# Altium project Adult_Main_Power_Unit.PrjPcb
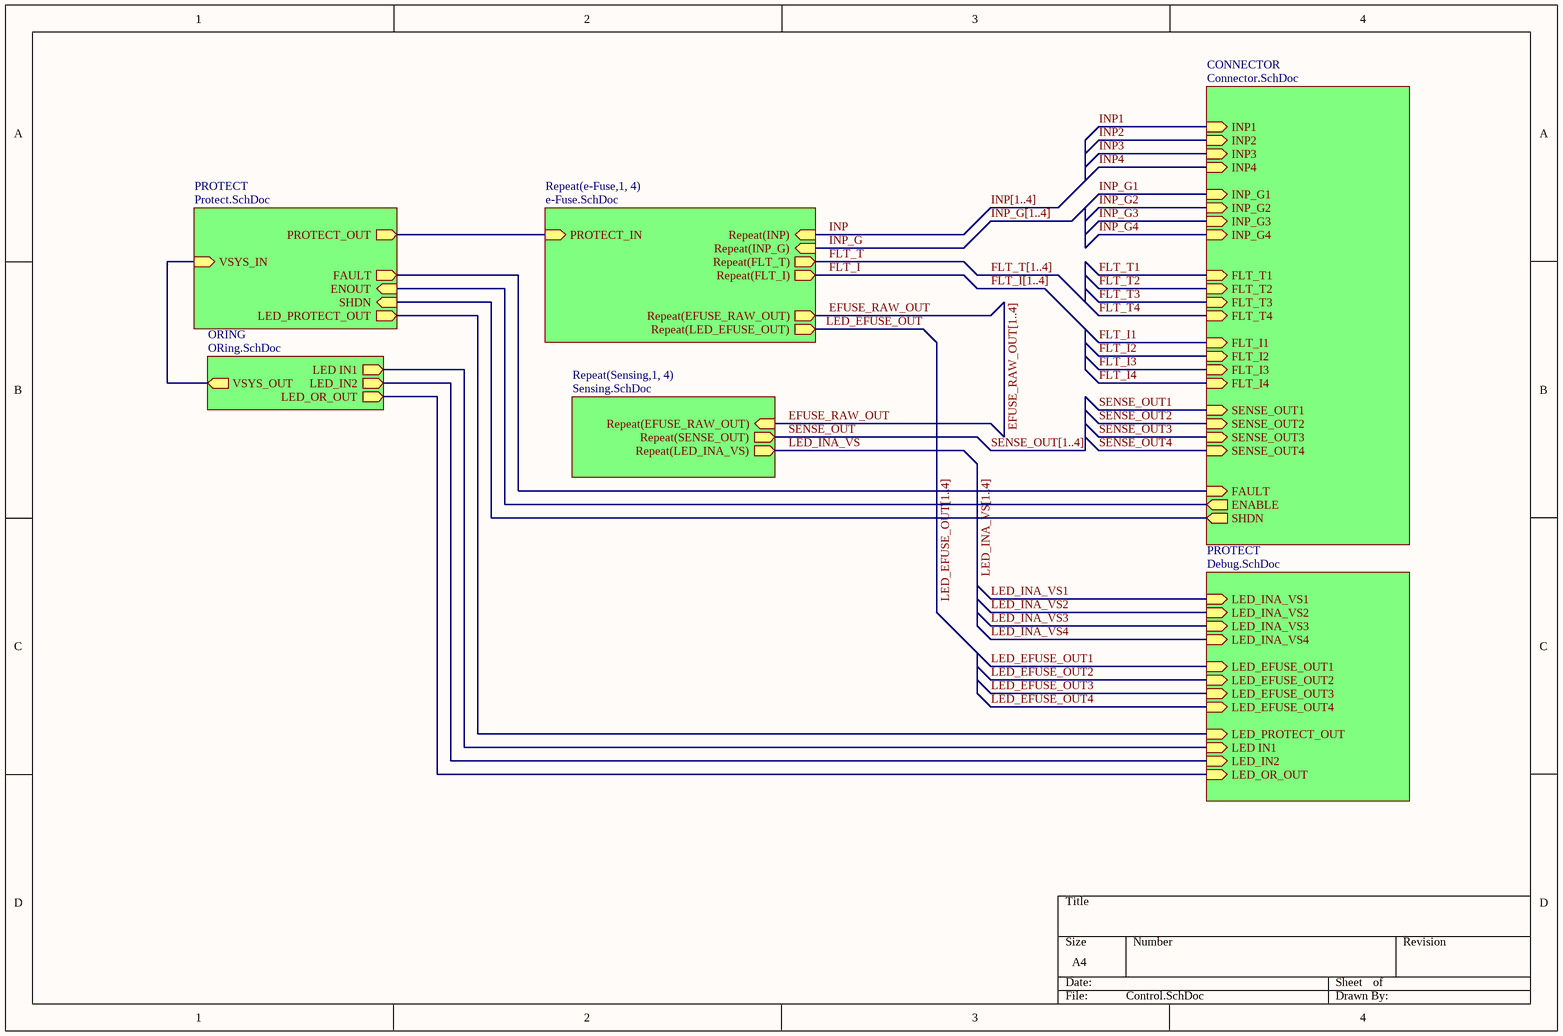
[diagram p0: Control.SchDoc]
7 sheets, 251 parts. Net scope: hierarchical (ports join the sheet entries above them; power ports are global).
Board file: Main_Power_Uint_3rd.PcbDoc
Sheets:
  Control.SchDoc
    PROTECT = Protect.SchDoc
    e-Fuse1 = e-Fuse.SchDoc
    e-Fuse2 = e-Fuse.SchDoc
    e-Fuse3 = e-Fuse.SchDoc
    e-Fuse4 = e-Fuse.SchDoc
    CONNECTOR = Connector.SchDoc
    ORING = ORing.SchDoc
    Sensing1 = Sensing.SchDoc
    Sensing2 = Sensing.SchDoc
    Sensing3 = Sensing.SchDoc
    Sensing4 = Sensing.SchDoc
    PROTECT = Debug.SchDoc

## Sheet Control.SchDoc
size A4; SheetNumber: 1; SheetTotal: 7

### Sub-sheets
CONNECTOR = Connector.SchDoc: FLT_I4 (in), FLT_T4 (in), INP_G4 (in), INP4 (in), FLT_I3 (in), FLT_T3 (in), INP_G3 (in), INP3 (in), FLT_I2 (in), FLT_T2 (in), INP_G2 (in), INP2 (in), FLT_I1 (in), FLT_T1 (in), INP_G1 (in), INP1 (in), SENSE_OUT4 (in), SENSE_OUT3 (in), SENSE_OUT2 (in), SENSE_OUT1 (in), FAULT (in), ENABLE (out), SHDN (out)
ORING = ORing.SchDoc: LED IN1 (out), LED_IN2 (out), LED_OR_OUT (out), VSYS_OUT (out)
PROTECT = Protect.SchDoc: PROTECT_OUT (out), SHDN (in), FAULT (out), VSYS_IN (in), ENOUT (in), LED_PROTECT_OUT (out)
PROTECT = Debug.SchDoc: LED_INA_VS1 (in), LED_INA_VS2 (in), LED_INA_VS3 (in), LED_INA_VS4 (in), LED_OR_OUT (in), LED_IN2 (in), LED IN1 (in), LED_PROTECT_OUT (in), LED_EFUSE_OUT1 (in), LED_EFUSE_OUT2 (in), LED_EFUSE_OUT3 (in), LED_EFUSE_OUT4 (in)
Repeat(e-Fuse,1, 4) = e-Fuse.SchDoc: Repeat(EFUSE_RAW_OUT) (out), Repeat(FLT_I) (out), Repeat(FLT_T) (out), Repeat(INP_G) (in), Repeat(INP) (in), PROTECT_IN (in), Repeat(LED_EFUSE_OUT) (out)
Repeat(Sensing,1, 4) = Sensing.SchDoc: Repeat(EFUSE_RAW_OUT) (in), Repeat(SENSE_OUT) (out), Repeat(LED_INA_VS) (out)

### Nets
VSYS_IN: sheet PROTECT/VSYS_IN, sheet ORING/VSYS_OUT
EFUSE_RAW_OUT: sheet Repeat(e-Fuse,1, 4)/Repeat(EFUSE_RAW_OUT), sheet Repeat(Sensing,1, 4)/Repeat(EFUSE_RAW_OUT)
ENOUT: sheet PROTECT/ENOUT, sheet CONNECTOR/ENABLE
FAULT: sheet PROTECT/FAULT, sheet CONNECTOR/FAULT
FLT_I: sheet Repeat(e-Fuse,1, 4)/Repeat(FLT_I)
FLT_T: sheet Repeat(e-Fuse,1, 4)/Repeat(FLT_T)
I_SENSE_N: sheet PROTECT/PROTECT_OUT, sheet Repeat(e-Fuse,1, 4)/PROTECT_IN
INP: sheet Repeat(e-Fuse,1, 4)/Repeat(INP)
INP_G: sheet Repeat(e-Fuse,1, 4)/Repeat(INP_G)
LED IN1: sheet ORING/LED IN1, sheet PROTECT/LED IN1
LED IN2: sheet ORING/LED_IN2, sheet PROTECT/LED_IN2
LED_EFUSE_OUT: sheet Repeat(e-Fuse,1, 4)/Repeat(LED_EFUSE_OUT)
LED_INA_VS: sheet Repeat(Sensing,1, 4)/Repeat(LED_INA_VS)
LED_OR_OUT: sheet ORING/LED_OR_OUT, sheet PROTECT/LED_OR_OUT
SENSE_OUT: sheet Repeat(Sensing,1, 4)/Repeat(SENSE_OUT)
SHDN: sheet PROTECT/SHDN, sheet CONNECTOR/SHDN
NetJ?_2: sheet PROTECT/LED_PROTECT_OUT, sheet PROTECT/LED_PROTECT_OUT

### Buses and harness runs
bus EFUSE_RAW_OUT[1..4]
bus FLT_I[1..4]
bus FLT_T[1..4]
bus INP[1..4]
bus INP_G[1..4]
bus LED_EFUSE_OUT[1..4]
bus LED_INA_VS[1..4]
bus SENSE_OUT[1..4]

## Sheet Protect.SchDoc
size A2; SheetNumber: 3; SheetTotal: 7; SPICEModelCacheXTCJCDQW: <root> / <DocumentId>XTCJCDQW</DocumentId> / <CacheFrame Number="0"> / <Model Name="umk107b7474_a-tr" Kind="CKT"> / <Text>* UMK107B7474_A-TR     SPICE MODEL  ( General Type ) / *-------------------------------------------------------------------------------------------------------- / * Model Generated by TAIYO YUDEN Corporation (http://www.ty-top.com) / * Version 1.0 / * TAIYO YUDEN Control No. 170508_110119 / * Copyright(c) 2012 TAIYO YUDEN CO.,LTD. All Rights Reserved. / *-------------------------------------------------------------------------------------------------------- / * / * Products Name : Multilayer Ceramic Capacitors / * / * Characteristics : / *     Capacitance : 0.47 uF , Rated Voltage : 50V , TCC : X7R / *     Case Size : 1.6 x 0.8 / 0.063 x 0.031 [mm/inch] , Thickness : 0.8 / 0.031 [mm/inch] / *     (Conditions: Temperature = 25 degC , DC Bias Current/Voltage = 0A / 0V) / * / * Frequency Range : 40Hz - 3GHz / * / * External Node Assignments : / * / *  1  o---| |---o  2 / * / *-------------------------------------------------------------------------------------------------------- / .SubCkt UMK107B7474_A-TR 1 2 / **************************** / C0 1 110 0.3527u / Cm 1 101 0.045459u / C1 101 102 0.11169u / Rc1 101 102 6.9463k / C2 102 103 0.051734u / Rc2 102 103 650.62 / C3 103 110 0.038139u / Rc3 103 110 34.263 / C2m 1 301 0.059649u / C21 301 302 0.33581u / Rc21 301 302 11.28k / C22 302 303 0.20392u / Rc22 302 303 18.494k / C23 303 304 0.29488u / Rc23 303 304 12.333k / C24 304 305 0.15021u / Rc24 304 305 1.1637k / C25 305 306 0.15017u / Rc25 305 306 1.0968k / C26 306 307 0.081575u / Rc26 306 307 74.316 / C27 307 308 0.067021u / Rc27 307 308 74.754 / C28 308 309 0.05622u / Rc28 308 309 85.848 / C29 309 110 3839.3p / Rc29 309 110 14.414 / Rp0 1 110 1.06382978723404G / L0 110 120 0.25717n / Lm 120 130 0.18418n / L1 120 121 0.16238n / RL1 121 130 0.10645 / L2 120 122 1.5526n / RL2 122 130 1.0028 / L3 120 123 2.68n / RL3 123 130 1.6719 / CR 120 124 0.037577u / LR 124 125 0.31279n / RR 125 130 90.675m / CL 130 140 1.8724p / LL 130 140 0.25802n / RL 130 140 37.565 / Rs 140 2 10.204m / **************************** / .ends UMK107B7474_A-TR</Text> / </Model> / </CacheFrame> / </root>
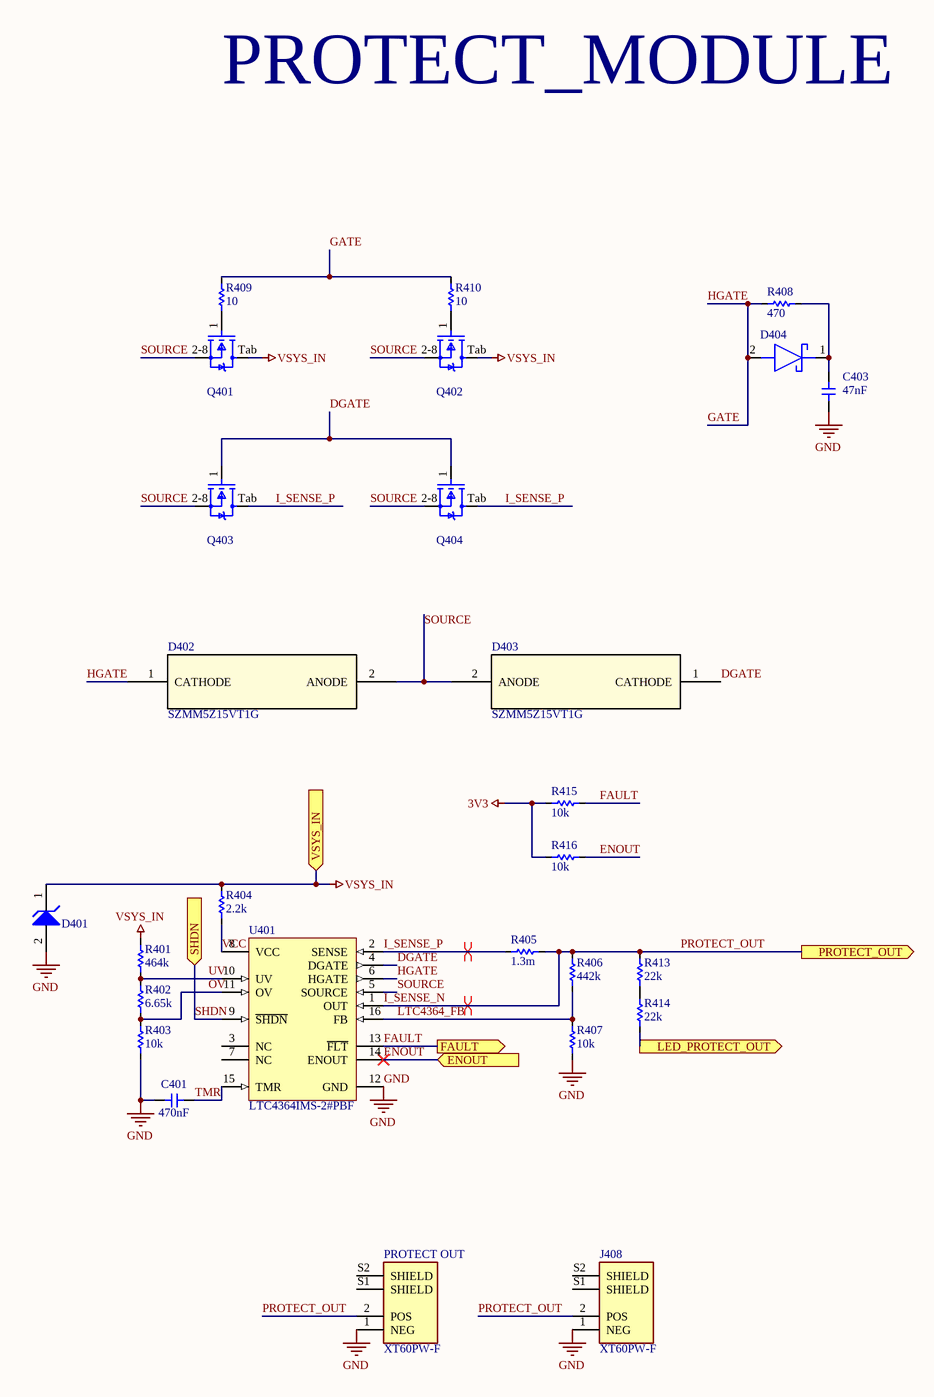
[diagram p1: Protect.SchDoc]

### Parts
C401  Capacitance: 470nF  [C0603]  (hidden comment: C_0603_470NF_10P_50V_X7R)
C403  Capacitance: 47nF  [C0603]  (hidden comment: C_0603_47NF_10P_100V_X7R)
D401  1SMB5945BT3G  [ONSC-SMB-2-403A-03_H_V]  (value not drawn)
D402  SZMM5Z15VT1G  [SOD-523_0P9X1P3_ONS]
D403  SZMM5Z15VT1G  [SOD-523_0P9X1P3_ONS]
D404  SMD110PL-TP  [SODFL3616X135N]  (value not drawn)
J408  XT60PW-F  [XT60PW-F]
PROTECT_OUT  XT60PW-F  [XT60PW-F]
Q401  Trans_Infineon_IPT015N10N5_eec  [Infineon_IPT015N10N5_0]  (value not drawn)
Q402  Trans_Infineon_IPT015N10N5_eec  [Infineon_IPT015N10N5_0]  (value not drawn)
Q403  Trans_Infineon_IPT015N10N5_eec  [Infineon_IPT015N10N5_0]  (value not drawn)
Q404  Trans_Infineon_IPT015N10N5_eec  [Infineon_IPT015N10N5_0]  (value not drawn)
R401  Resistance: 464k  [R0603]  (hidden comment: R_0603_464K_1P_0P1W)
R402  Resistance: 6.65k  [R0603]  (hidden comment: R_0603_6R65K_1P_0P1W)
R403  Resistance: 10k  [R0603]  (hidden comment: R_0603_10K_1P_0P1W)
R404  Resistance: 2.2k  [R2512]  (hidden comment: R_2512_2R2K_1P_2W)
R405  Resistance: 1.3m  [R2512]  (hidden comment: R_2512_1mR3_1P_3W)
R406  Resistance: 442k  [R0603]  (hidden comment: R_0603_442K_1P_0P1W)
R407  Resistance: 10k  [R0603]  (hidden comment: R_0603_10K_1P_0P1W)
R408  Resistance: 470  [R0603]  (hidden comment: R_0603_470R_1P_0P1W)
R409  Resistance: 10  [R0603]  (hidden comment: R_0603_10R_1P_0P1W)
R410  Resistance: 10  [R0603]  (hidden comment: R_0603_10R_1P_0P1W)
R413  Resistance: 22k  [R0603]  (hidden comment: R_0603_22K_1P_0P1W)
R414  Resistance: 22k  [R0603]  (hidden comment: R_0603_22K_1P_0P1W)
R415  Resistance: 10k  [R0603]  (hidden comment: R_0603_10K_1P_0P1W)
R416  Resistance: 10k  [R0603]  (hidden comment: R_0603_10K_1P_0P1W)
U401  LTC4364IMS-2#PBF  [LT-MS-16_M]

### Ports
ENOUT (in, see Control[2B]), FAULT (out, see Control[2B], Connector[2A]), LED_PROTECT_OUT (out, see Control[2B], Debug[2B]), PROTECT_OUT (out, see Control[2A]), SHDN (in, see Control[2B], Connector[2A]), VSYS_IN (in, see Control[1B])

### Nets
3V3: R415.1 R416.1
GND: C401.1 C403.1 D401.2(A) J408.1(NEG) PROTECT_OUT.1(NEG) R403.1 R407.1 U401.12(GND)
VSYS_IN: D401.1(K) Q401.Tab(Drain) Q402.Tab(Drain) R401.2 R404.2 ; port VSYS_IN
DGATE: D403.1(CATHODE) Q403.1(Gate) Q404.1(Gate) U401.4(DGATE)
ENOUT: R416.2 U401.14(ENOUT) ; port ENOUT
FAULT: R415.2 U401.13(~{FLT}) ; port FAULT
GATE: D402.1(CATHODE) D404.2(A) R408.1 R409.2 R410.2 U401.6(HGATE)  [also labelled HGATE]
I_SENSE_N: J408.2(POS) PROTECT_OUT.2(POS) R405.2 R406.2 R413.2 U401.1(OUT) ; port PROTECT_OUT  [also labelled PROTECT_OUT]
I_SENSE_P: Q403.Tab(Drain) Q404.Tab(Drain) R405.1 U401.2(SENSE)
LTC4364_FB: R406.1 R407.2 U401.16(FB)
OV: R402.1 R403.2 U401.11(OV)
SHDN: U401.9(~{SHDN}) ; port SHDN
SOURCE: D402.2(ANODE) D403.2(ANODE) Q401.2-8(Source) Q402.2-8(Source) Q403.2-8(Source) Q404.2-8(Source) U401.5(SOURCE)
TMR: C401.2 U401.15(TMR)
UV: R401.1 R402.2 U401.10(UV)
VCC: R404.1 U401.8(VCC)
NetC403_2: C403.2 D404.1(K) R408.2
NetJ?_2: R414.1 ; port LED_PROTECT_OUT
NetQ401_1: Q401.1(Gate) R409.1
NetQ402_1: Q402.1(Gate) R410.1
NetR413_1: R413.1 R414.2

Not connected (* = marked no-connect by the designer): J408 S1(SHIELD) S2(SHIELD); PROTECT_OUT S1(SHIELD) S2(SHIELD); U401 3(NC) 7(NC)

### Layout directives
differential pair: I_SENSE_N, I_SENSE_P

### Notes on the sheet
- PROTECT_MODULE

### Library data of the parts
C401 = CMP-00074-1: MLCC, 470nF, 10%, 50V, X7R, 0603; Voltage Rating: 50V; Dielectric: X7R; Package: 0603; Tolerance: 10%; Mounting Type: SMD
C403 = CMP-00075-1: MLCC, 47nF, 10%, 100V, X7R, 0603; Tolerance: 10%; Package: 0603; Mounting Type: SMD; Dielectric: X7R; Voltage Rating: 100V
D401 = CMP-1060-00175-1: 3 W Zener Voltage Regulator, 2-Pin SMB, Pb-Free, Tape and Reel; Manufacturer: On Semiconductor; VZ Typ (V): 68; ComponentLink3URL: http://www.onsemi.com/pub_link/Collateral/1SMB5913BT3-D.PDF; PackageReference: SMB-2-403A-03_H; PackageDescription: 2-Pin Small Molded Package, J-Bend Lead, Body 4.33 x 3.625 mm; PackageVersion: Rev. H, 05/2011; PartNumber: 1SMB5945BT3G; DatasheetVersion: Rev. 8; ComponentLink1Description: Manufacturer URL; ComponentLink1URL: http://www.onsemi.com/; RoHS: Pb-Free; ComponentLink2Description: Datasheet; Packing: Tape and Reel; ComponentLink2URL: http://www.onsemi.com/pub_link/Collateral/1SMB5913BT3-D.PDF; ComponentLink3Description: Package Specification; Mounting Technology: Surface Mount
D402 D403 = CMP-301-000000-1: Description; Manufacturer_Name: onsemi; RefDes: RefDes; Source: SZMM5Z15VT1G.SchLib; Copyright: Copyright (C) 2025 Ultra Librarian. All rights reserved.; Design Item ID: SZMM5Z15VT1G; Type: Type; Manufacturer_Part_Number: SZMM5Z15VT1G
D404 = SMD110PL-TP: Schottky Diode; Manufacturer_Name: MCC; Datasheet Link: https://www.mccsemi.com/pdf/Products/SMD15PL-SMD1200PL(SOD-123FL).pdf; Height: 1.35mm; Manufacturer_Part_Number: SMD110PL-TP; Mouser Part Number: 833-SMD110PL-TP; Mouser Price/Stock: https://www.mouser.co.uk/ProductDetail/Micro-Commercial-Components-MCC/SMD110PL-TP?qs=xjxbgUsuSIBtRX%252BtbqnRwQ%3D%3D; Arrow Part Number: SMD110PL-TP; Arrow Price/Stock: https://www.arrow.com/en/products/smd110pl-tp/micro-commercial-components?utm_currency=USD&region=europe
J408 PROTECT_OUT = CMP-019-000058-2: Socket DC Supply Connector Female; MF: AMASS; Price: None; Value: *; Package: Package; Check_prices: https://www.snapeda.com/parts/XT60PW-F/AMASS/view-part/?ref=eda; Design Item ID: XT60PW-F; SnapEDA_Link: https://www.snapeda.com/parts/XT60PW-F/AMASS/view-part/?ref=snap; MP: XT60PW-F; Availability: Not in stock; System: Connector; Source: robit_connector.SchLib
Q401-Q404 = Trans_Infineon_IPT015N10N5_eec: TRANS MOSFET N-CH 100V 300A 8HSOF; Part Number: IPT015N10N5; helpURL: https://upverter.com/upn/revision/59ddb1136ed40b7f/; ComponentLink2Description: Datasheet; Temperature: -55°C to +175°C; Package: HSOF8; Supplier 2: Mouser; Supplier 1: Digi-Key; ComponentLink1URL: https://upverter.com/upn/revision/59ddb1136ed40b7f/; Supplier Part Number 2: 726-IPT015N10N5ATMA1; Supplier Part Number 1: IPT015N10N5ATMA1CT-ND; Manufacturer: Infineon; ComponentLink1Description: Upverter; ComponentLink2URL: http://www.infineon.com/dgdl/Infineon-IPT015N10N5-DS-v02_02-EN.pdf?fileId=5546d4624a75e5f1014ac94680661aff; RoHS: TRUE; Mouser Part Number: 726-IPT015N10N5ATMA1; Temperature Range High: +175°C; Digikey Description: TRANS MOSFET N-CH 100V 300A 8HSOF; Digikey Part Number: IPT015N10N5ATMA1CT-ND; Lead Free: yes; Temperature Range Low: -55°C
R401 = CMP-00067-2: Chip resistor, 464k Ohm, 1%, 0.1W, 0603; Voltage Rating: 75V; Power Rating: 100mW; Mounting Type: SMD; Package: 0603; Tolerance: 1%
R402 = CMP-00068-1: Chip resistor, 6.65k Ohm, 1%, 0.1W, 0603; Power Rating: 100mW; Voltage Rating: 75V; Package: 0603; Mounting Type: SMD; Tolerance: 1%
R403 R407 R415 R416 = CMP-00032-1: Chip resistor, 10k Ohm, 1%, 0.1W, 0603; Power Rating: 100mW; Voltage Rating: 75V; Package: 0603; Mounting Type: SMD; Tolerance: 1%
R404 = CMP-00066-1: Chip resistor, 2.2k Ohm, ±1%, 2W, 2512; Tolerance: 1%; Package: 2512; Mounting Type: SMD; Power Rating: 2W
R405 = CMP-00073-2: Chip resistor, 1.3m Ohm, ±1%, 3W, 2512; Tolerance: 1%; Mounting Type: SMD; Package: 2512; Power Rating: 3W
R406 = CMP-00070-1: Chip resistor, 442k Ohm, 1%, 0.1W, 0603; Power Rating: 100mW; Voltage Rating: 75V; Mounting Type: SMD; Package: 0603; Tolerance: 1%
R408 = CMP-00069-1: Chip resistor, 470 Ohm, 1%, 0.1W, 0603; Voltage Rating: 75V; Power Rating: 100mW; Tolerance: 1%; Mounting Type: SMD; Package: 0603
R409 R410 = CMP-00010-8: Chip resistor, 10 Ohm, 1%, 0.1W, 0603; Power Rating: 100mW; Voltage Rating: 50V; Package: 0603; Mounting Type: SMD; Tolerance: 1%
R413 R414 = CMP-00064-1: Chip resistor, 22k Ohm, 1%, 0.1W, 0603; Power Rating: 100mW; Voltage Rating: 75V; Tolerance: 1%; Mounting Type: SMD; Package: 0603
U401 = CMP-0474-00539-1: Surge Stopper with Ideal Diode, 4 to 80 V Vin, 16-pin SOP (MS-16), -40 to 85 degC, Pb-Free; Manufacturer: Linear Technology; Fast Comparator: no; Circuit Breaker Threshold: 50 mV; Circuit Breakers(#): 1; Active Limiting: yes; Vin Range: 4 to 80 V; Circuit Breaker Accuracy(%): 10; Extended Temp: C, I, H; ComponentLink1Description: Manufacturer URL; PackageReference: MS16; Mounting Technology: Surface Mount; RoHS: TRUE; PackageDescription: 16-Pin Plastic MSOP, Body 4.04 x 3.00 mm, Pitch 0.50 mm; ComponentLink3Description: Package Specification; PartNumber: LTC4364IMS-2#PBF; Power Good: no; ComponentLink2Description: Datasheet; ComponentLink2URL: http://cds.linear.com/docs/en/datasheet/436412f.pdf; ComponentLink1URL: http://www.linear.com/; ComponentLink3URL: http://cds.linear.com/docs/en/packaging/05081669_A_MS16.pdf; PackageVersion: Rev. Ã˜, 06/2010

## Sheet e-Fuse.SchDoc
size A3; SheetNumber: 4; SheetTotal: 7; SPICEModelCacheQSHFIDDY: <root> / <DocumentId>QSHFIDDY</DocumentId> / <CacheFrame Number="0"> / <Model Name="umk107b7474_a-tr" Kind="CKT"> / <Text>* UMK107B7474_A-TR     SPICE MODEL  ( General Type ) / *-------------------------------------------------------------------------------------------------------- / * Model Generated by TAIYO YUDEN Corporation (http://www.ty-top.com) / * Version 1.0 / * TAIYO YUDEN Control No. 170508_110119 / * Copyright(c) 2012 TAIYO YUDEN CO.,LTD. All Rights Reserved. / *-------------------------------------------------------------------------------------------------------- / * / * Products Name : Multilayer Ceramic Capacitors / * / * Characteristics : / *     Capacitance : 0.47 uF , Rated Voltage : 50V , TCC : X7R / *     Case Size : 1.6 x 0.8 / 0.063 x 0.031 [mm/inch] , Thickness : 0.8 / 0.031 [mm/inch] / *     (Conditions: Temperature = 25 degC , DC Bias Current/Voltage = 0A / 0V) / * / * Frequency Range : 40Hz - 3GHz / * / * External Node Assignments : / * / *  1  o---| |---o  2 / * / *-------------------------------------------------------------------------------------------------------- / .SubCkt UMK107B7474_A-TR 1 2 / **************************** / C0 1 110 0.3527u / Cm 1 101 0.045459u / C1 101 102 0.11169u / Rc1 101 102 6.9463k / C2 102 103 0.051734u / Rc2 102 103 650.62 / C3 103 110 0.038139u / Rc3 103 110 34.263 / C2m 1 301 0.059649u / C21 301 302 0.33581u / Rc21 301 302 11.28k / C22 302 303 0.20392u / Rc22 302 303 18.494k / C23 303 304 0.29488u / Rc23 303 304 12.333k / C24 304 305 0.15021u / Rc24 304 305 1.1637k / C25 305 306 0.15017u / Rc25 305 306 1.0968k / C26 306 307 0.081575u / Rc26 306 307 74.316 / C27 307 308 0.067021u / Rc27 307 308 74.754 / C28 308 309 0.05622u / Rc28 308 309 85.848 / C29 309 110 3839.3p / Rc29 309 110 14.414 / Rp0 1 110 1.06382978723404G / L0 110 120 0.25717n / Lm 120 130 0.18418n / L1 120 121 0.16238n / RL1 121 130 0.10645 / L2 120 122 1.5526n / RL2 122 130 1.0028 / L3 120 123 2.68n / RL3 123 130 1.6719 / CR 120 124 0.037577u / LR 124 125 0.31279n / RR 125 130 90.675m / CL 130 140 1.8724p / LL 130 140 0.25802n / RL 130 140 37.565 / Rs 140 2 10.204m / **************************** / .ends UMK107B7474_A-TR</Text> / </Model> / </CacheFrame> / </root>
Used 4 times, as channels e-Fuse1, e-Fuse2, e-Fuse3, e-Fuse4. Parts and nets are listed once, with the designators drawn on the sheet.
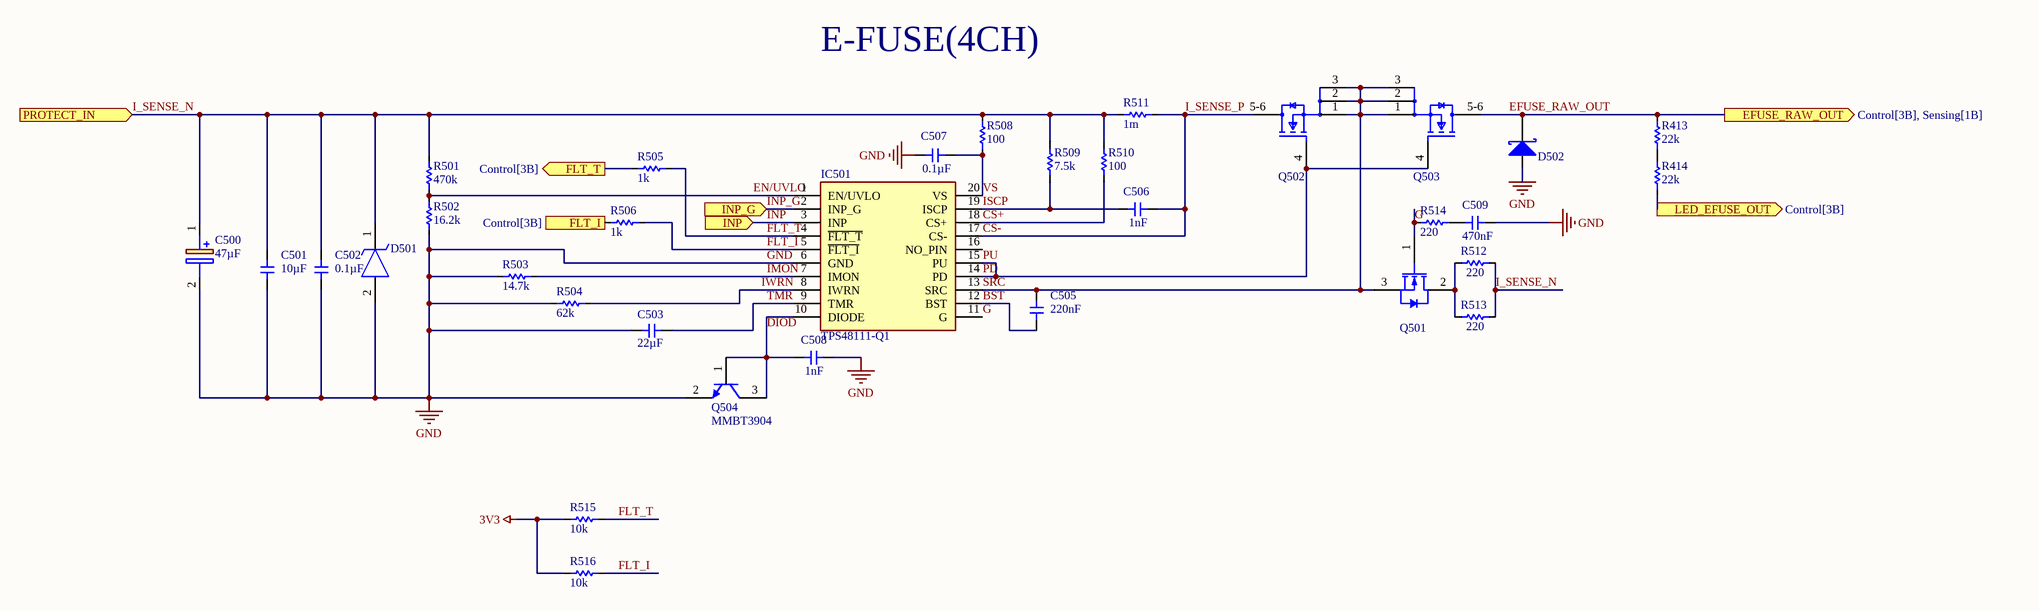
[diagram p2: e-Fuse.SchDoc]

### Parts
C500  47µF  [CAPAE1030X1050N]
C501  Capacitance: 10µF  [C1210]  (hidden comment: C_1210_10UF_10P_100V_X7R)
C502  Capacitance: 0.1µF  [C0603]  (hidden comment: C_0603_0P1UF_10P_100V_X7R)
C503  Capacitance: 22µF  [C0603]  (hidden comment: C_0603_22UF_20P_10V_X7R)
C505  Capacitance: 220nF  [C0603]  (hidden comment: C_0603_220NF_10P_25V_X7R)
C506  Capacitance: 1nF  [C0603]  (hidden comment: C_0603_1NF_10P_100V_X7R)
C507  Capacitance: 0.1µF  [C0603]  (hidden comment: C_0603_0P1UF_10P_100V_X7R)
C508  Capacitance: 1nF  [C0603]  (hidden comment: C_0603_1NF_10P_50V_X7R)
C509  Capacitance: 470nF  [C0805]  (hidden comment: C_0805_470NF_10P_100V_C0G)
D501  SMLJ58AQ-TP  [DIOM7959X282N]  (value not drawn)
D502  DFLS1100-7  [DIOD-POWERDI123-2_V]  (value not drawn)
IC501  TPS48111-Q1  [SOP50P490X110-20N]
Q501  IPD068N10N3 G  [INF-PG-TO252-3-11_A_L]  (value not drawn)
Q502  NVMFS015N10MCLT1G  [FP-488AA-MFG]  (value not drawn)
Q503  NVMFS015N10MCLT1G  [FP-488AA-MFG]  (value not drawn)
Q504  MMBT3904  [FAIR-SOT23-3_V]
R413  Resistance: 22k  [R0603]  (hidden comment: R_0603_22K_1P_0P1W)
R414  Resistance: 22k  [R0603]  (hidden comment: R_0603_22K_1P_0P1W)
R501  Resistance: 470k  [R0603]  (hidden comment: R_0603_470K_1P_0P1W)
R502  Resistance: 16.2k  [R0603]  (hidden comment: R_0603_16K2_0P1_0P1W)
R503  Resistance: 14.7k  [R0603]  (hidden comment: R_0603_14K7_0P1_0P1W)
R504  Resistance: 62k  [R0603]  (hidden comment: R_0603_66K_1P_0P1W)
R505  Resistance: 1k  [R0603]  (hidden comment: R_0603_1K_1P_0P1W)
R506  Resistance: 1k  [R0603]  (hidden comment: R_0603_1K_1P_0P1W)
R508  Resistance: 100  [R0603]  (hidden comment: R_0603_100R_1P_0P1W)
R509  Resistance: 7.5k  [R0603]  (hidden comment: R_0603_7K5_1P_0P1W)
R510  Resistance: 100  [R0603]  (hidden comment: R_0603_100R_1P_0P1W)
R511  Resistance: 1m  [R2512]  (hidden comment: R_2512_1mR_1P_3W)
R512  Resistance: 220  [R2512]  (hidden comment: R_2512_220R_1P_2W)
R513  Resistance: 220  [R2512]  (hidden comment: R_2512_220R_1P_2W)
R514  Resistance: 220  [R0603]  (hidden comment: R_0603_220R_1P_0P1W)
R515  Resistance: 10k  [R0603]  (hidden comment: R_0603_10K_1P_0P1W)
R516  Resistance: 10k  [R0603]  (hidden comment: R_0603_10K_1P_0P1W)

### Ports
EFUSE_RAW_OUT (out, see Control[3B], Sensing[1B]), FLT_I (out, see Control[3B]), FLT_T (out, see Control[3B]), INP (in, see Control[3A]), INP_G (in, see Control[3A]), LED_EFUSE_OUT (out, see Control[3B]), PROTECT_IN (in, see Control[2A])

### Nets
3V3: R515.1 R516.1
GND: C500.2(-) C501.1 C502.1 C503.1 C507.2 C508.2 C509.2 D501.2(A) D502.1(A) IC501.6(GND) Q504.2(E) R502.1 R503.1 R504.1
BST: C505.1 IC501.12(BST)
CS+: IC501.18(CS+) R510.1
CS-: C506.2 IC501.17(CS-) Q502.5-6(D) R511.2  [also labelled I_SENSE_P]
DIOD: C508.1 IC501.10(DIODE) Q504.1(B) Q504.3(C)
EFUSE_RAW_OUT: D502.2(K) Q503.5-6(D) R413.2 ; port EFUSE_RAW_OUT
EN/UVLO: IC501.1(EN/UVLO) R501.1 R502.2
FLT_I: IC501.5(~{FLT_I}) R506.2 R516.2
FLT_I: R506.1 ; port FLT_I  [a separate net that carries the same name]
FLT_T: IC501.4(~{FLT_T}) R505.2 R515.2
FLT_T: R505.1 ; port FLT_T  [a separate net that carries the same name]
G: IC501.11(G) Q501.1(GATE) R514.1
I_SENSE_N: C500.1(+) C501.2 C502.2 D501.1(K) R501.2 R508.2 R509.2 R510.2 R511.1 R512.2 R513.2 ; port PROTECT_IN
IMON: IC501.7(IMON) R503.2
INP: IC501.3(INP) ; port INP
INP_G: IC501.2(INP_G) ; port INP_G
ISCP: C506.1 IC501.19(ISCP) R509.1
IWRN: IC501.8(IWRN) R504.2
LED_EFUSE_OUT: R414.1 ; port LED_EFUSE_OUT
PD: IC501.14(PD) IC501.15(PU) Q502.4(G) Q503.4(G)  [also labelled PU]
SRC: C505.2 IC501.13(SRC) Q501.3(SOURCE) Q502.1(S) Q502.2(S) Q502.3(S) Q503.1(S) Q503.2(S) Q503.3(S)
TMR: C503.2 IC501.9(TMR)
VS: C507.1 IC501.20(VS) R508.1
NetC509_1: C509.1 R514.2
NetQ501_2: Q501.2(DRAIN) R512.1 R513.1
NetR413_1: R413.1 R414.2

Not connected (* = marked no-connect by the designer): IC501 16(NO_PIN)

### Channels
e-Fuse1: designators end in _1; ports EFUSE_RAW_OUT=EFUSE_RAW_OUT FLT_I=FLT_I1 FLT_T=FLT_T1 INP=INP INP_G=INP_G LED_EFUSE_OUT=LED_EFUSE_OUT1 PROTECT_IN=I_SENSE_N
e-Fuse2: designators end in _2; ports EFUSE_RAW_OUT=EFUSE_RAW_OUT FLT_I=FLT_I2 FLT_T=FLT_T2 INP=INP INP_G=INP_G LED_EFUSE_OUT=LED_EFUSE_OUT2 PROTECT_IN=I_SENSE_N
e-Fuse3: designators end in _3; ports EFUSE_RAW_OUT=EFUSE_RAW_OUT FLT_I=FLT_I3 FLT_T=FLT_T3 INP=INP INP_G=INP_G LED_EFUSE_OUT=LED_EFUSE_OUT3 PROTECT_IN=I_SENSE_N
e-Fuse4: designators end in _4; ports EFUSE_RAW_OUT=EFUSE_RAW_OUT FLT_I=FLT_I4 FLT_T=FLT_T4 INP=INP INP_G=INP_G LED_EFUSE_OUT=LED_EFUSE_OUT4 PROTECT_IN=I_SENSE_N

### Notes on the sheet
- E-FUSE(4CH)

### Library data of the parts
C500 = UUX2A470MNL1GS: Capacitor Polarised; Manufacturer_Name: Nichicon; Datasheet Link: https://componentsearchengine.com/Datasheets/1/UUX2A470MNL1GS.pdf; Height: 10.5mm; Manufacturer_Part_Number: UUX2A470MNL1GS; Mouser Part Number: 647-UUX2A470MNL1GS; Mouser Price/Stock: https://www.mouser.co.uk/ProductDetail/Nichicon/UUX2A470MNL1GS?qs=jZZh9D7uMhmPZMofMKn2Fg%3D%3D; Arrow Part Number: UUX2A470MNL1GS; Arrow Price/Stock: https://www.arrow.com/en/products/uux2a470mnl1gs/nichicon?utm_currency=USD&region=nac
C501 = CMP-00030-3: MLCC, 10µF, 10%, 100V, X7R, 1210; Dielectric: X7S; Mounting Type: SMD; Tolerance: 10%; Package: 1210; Voltage Rating: 100V
C502 C507 = CMP-00021-3: MLCC, 0.1µF, 10%, 100V, X7R, 0603; Dielectric: X7R; Mounting Type: SMD; Tolerance: 10%; Package: 0603; Voltage Rating: 100V
C503 = CMP-00082-1: MLCC, 22µF, 20%, 10V, X5R, 0603; Tolerance: 20%; Package: 0603; Voltage Rating: 10V; Mounting Type: SMD; Dielectric: X5R
C505 = CMP-00088-1: MLCC, 220nF, 10%, 25V, X7R, 0603; Package: 0603; Voltage Rating: 25V; Dielectric: X7R; Mounting Type: SMD; Tolerance: 10%
C506 = CMP-00036-1: MLCC, 1nF, 10%, 100V, X7R, 0603; Package: 0603; Mounting Type: SMD; Dielectric: X7R; Tolerance: 10%; Voltage Rating: 100V
C508 = CMP-00046-1: MLCC, 1nF, 10%, 50V, X7R, 0603; Tolerance: 10%; Package: 0603; Dielectric: X7R; Voltage Rating: 50V; Mounting Type: SMD
C509 = CMP-00087-1: MLCC, 470nF, 10%, 100V, C0G, 0805; Dielectric: X7R; Tolerance: 10%; Mounting Type: SMD; Package: 0805; Voltage Rating: 100V
D501 = SMLJ58AQ-TP: TVS Diode (Uni-directional); Manufacturer_Name: MCC; Datasheet Link: https://www.mccsemi.com/pdf/Products/SMLJ5.0AQ_SMLJ85CAQ(SMC).pdf; Height: 2.823mm; Manufacturer_Part_Number: SMLJ58AQ-TP
D502 = CMP-2000-05099-1: 1 A High Voltage Schottky Barrier Rectifier, 0.62 V, -55 to 175 degC, 2- Pin POWERDI123, Pb-Free, Tape and Reel; Manufacturer: Diodes Inc; Average Rectified Current-Max: 1A; Peak Current-Max: 40A; Forward Voltage: 0.77V; Reverse Current-Max: 1µA; Reverse Voltage-Max [Vrrm]: 100V; Datasheet Version: Sep-14; Datasheet URL: https://datasheet.ciiva.com/15144/getdatasheetpartid-44146-15144126.pdf; Manufacturer URL: http://www.diodes.com/
IC501 = TPS48111-Q1: Integrated Circuit; Manufacturer_Name: Texas Instruments; Datasheet Link: https://www.ti.com/lit/ds/slusee5c/slusee5c.pdf; Height: 1.1mm; Manufacturer_Part_Number: TPS48111-Q1
Q501 = CMP-1091-00169-1: N-Channel OptiMOS 3 Power-Transistor, 100 V VDS, 90 A ID, -55 to 175 degC, PG-TO252-3-11, Reel, Green; Manufacturer: Infineon; QG: 51Â nC; RDS (on) (max): 6.8Â mOhm; RthJC (max): 1 K/W; VGS(th) (min): 2Â V; RthJA (max): 62 K/W; VDS (max): 100Â V; ID (max): 90Â A; Ptot (max): 150Â W; Green: TRUE; Polarity: N; VGS(th) (max): 3.5Â V; Rth: 1Â K/W; IDpuls (max): 360Â A; Packing: Reel; ComponentLink1Description: Manufacturer URL; Mounting Technology: Surface Mount; ComponentLink2Description: Datasheet; PartNumber: IPD068N10N3 G; ComponentLink2URL: http://www.infineon.com/dgdl/IPD068N10N3+G_Rev2.1.pdf?folderId=db3a304313b8b5a60113cee8763b02d7&fileId=db3a30431ce5fb52011d1eb7aeb615d1; DatasheetVersion: Rev. 2.1; ComponentLink3URL: http://www.infineon.com/dgdl/IPD160N04L_rev1.0.pdf?folderId=db3a3043163797a6011643468e7505a4&fileId=db3a3043163797a60116436401cf05cf; PackageReference: PG-TO252-3-11; PackageVersion: Rev. 02, 03/2007; ComponentLink1URL: http://www.infineon.com/; PackageDescription: 3-Pin Plastic (Green) Transistor Single Outline Package, 6.57 x 6.1 mm Body, 2.29 mm Pitch; ComponentLink3Description: Package Specification
Q502 Q503 = CMP-00278-108017151-1: NVMFS015N10MCLT1G Mosfet, N-Ch, 100V, 47.1A, Dfn Rohs Compliant: Yes; Manufacturer Lifecycle Status: ACTIVE; Lifecycle Status: Production; NexarPartId: 108017151
Q504 = CMP-1670-00008-1: NPN General Purpose Amplifier, 40 V, 0.2 A, -55 to 150 degC, 3-Pin SOT23, RoHS, Tape and Reel; Tolerance: 30ppm; Capacitance: 1.8E-11 f; Frequency: 12.288 MHz; ESR: 40 Ohm; Load Capacitance: 18 pF; REACH SVHC: No SVHC; Pins: 4; ComponentLink3URL: http://www.fairchildsemi.com/dwg/MA/MA03D.pdf; PackageDescription: 3-Pin Small Outline Transistor, Body 2.92 x 1.325 mm, Pitch 0.95 mm; ComponentLink1URL: https://www.fairchildsemi.com/; Max Operating Temperature: 70degC; PackageReference: SOT23-3; ComponentLink1Description: Manufacturer URL; Width: 0.126 inch; Min Operating Temperature: -20degC; DatasheetVersion: Rev. 1.1.0, 10/2014; Mount: Surface Mount; Height: 0.041 inch; Package Quantity: 1000; Frequency Tolerance: 30ppm; Packaging: Tape and Reel; ComponentLink2URL: https://www.fairchildsemi.com/datasheets/MM/MMBT3904.pdf; RoHSCompliant: True; ComponentLink3Description: Package Specification; ComponentLink2Description: Datasheet; Length: 0.197 inch
R413 R414 = CMP-00064-1: as R413 on sheet Protect; Tolerance: 1%; Mounting Type: SMD; Package: 0603
R501 = CMP-00071-1: Chip resistor, 470k Ohm, 1%, 0.1W, 0603; Power Rating: 100mW; Voltage Rating: 75V; Tolerance: 1%; Mounting Type: SMD; Package: 0603
R502 = CMP-00072-1: Chip resistor, 16.2k Ohm, 0.1%, 0.1W, 0603; Voltage Rating: 75V; Tolerance: 1%; Power Rating: 100mW; Package: 0603; Mounting Type: SMD
R503 = CMP-00076-1: Chip resistor, 14.7k Ohm, 0.1%, 0.1W, 0603; Voltage Rating: 75V; Power Rating: 100mW; Tolerance: 1%; Package: 0603; Mounting Type: SMD
R504 = CMP-00090-1: Chip resistor, 66k Ohm, 1%, 0.1W, 0603 / R504 -> 62k(다리, 20A), 82k(팔, 15A); Power Rating: 100mW; Voltage Rating: 75V; Mounting Type: SMD; Tolerance: 1%; Package: 0603
R505 R506 = CMP-00012-6: Chip resistor, 1k Ohm, 1%, 0.1W, 0603; Power Rating: 100mW; Voltage Rating: 50V; Mounting Type: SMD; Package: 0603; Tolerance: 1%
R508 R510 = CMP-00048-1: Chip resistor, 100 Ohm, 1%, 0.1W, 0603; Voltage Rating: 75V; Power Rating: 100mW; Tolerance: 1%; Mounting Type: SMD; Package: 0603
R509 = CMP-00079-1: Chip resistor, 7.5k Ohm, 1%, 0.1W, 0603 / R509 -> 7.5k(다리, 124A), 6.2k(팔, 104A); Voltage Rating: 75V; Power Rating: 100mW; Package: 0603; Mounting Type: SMD; Tolerance: 1%
R511 = CMP-00089-1: Chip resistor, 1m Ohm, ±1%, 3W, 2512; Mounting Type: SMD; Package: 2512; Power Rating: 3W; Tolerance: 1%
R512 R513 = CMP-00081-1: Chip resistor, 220 Ohm, ±1%, 2W, 2512; Power Rating: 2W; Tolerance: 1%; Package: 2512; Mounting Type: SMD
R514 = CMP-00080-1: Chip resistor, 220 Ohm, 1%, 0.1W, 0603; Voltage Rating: 75V; Power Rating: 100mW; Mounting Type: SMD; Tolerance: 1%; Package: 0603
R515 R516 = CMP-00032-1: as R403 on sheet Protect; Package: 0603; Mounting Type: SMD; Tolerance: 1%

## Sheet Connector.SchDoc
size A4; SheetNumber: 6; SheetTotal: 7
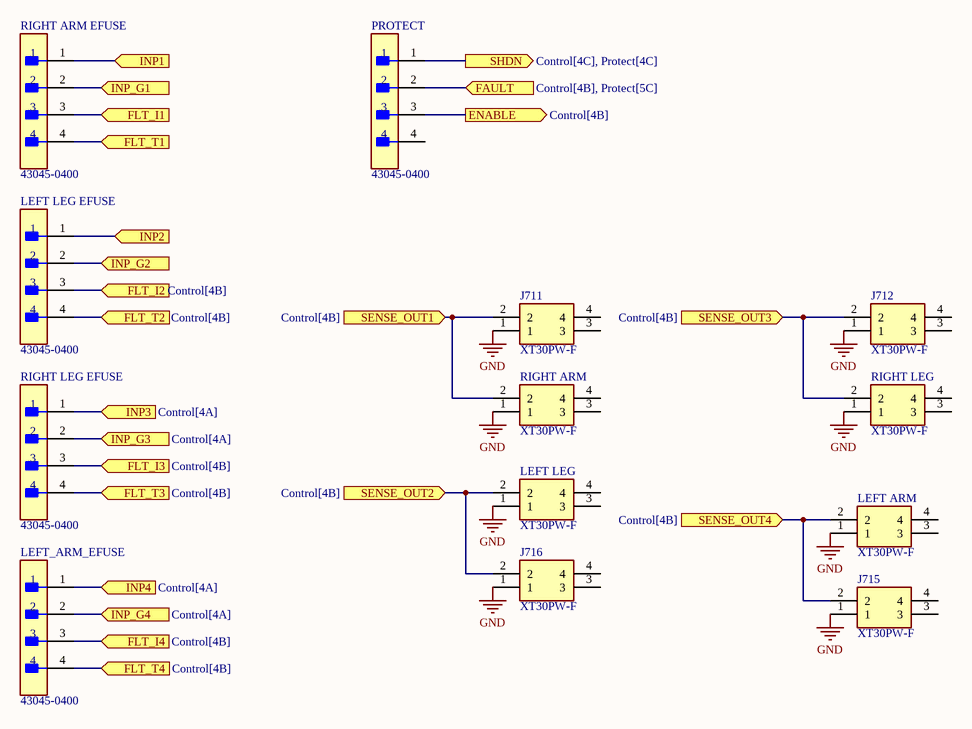
[diagram p3: Connector.SchDoc]

### Parts
J711  XT30PW-F  [XT30PWF]
J712  XT30PW-F  [XT30PWF]
J715  XT30PW-F  [XT30PWF]
J716  XT30PW-F  [XT30PWF]
LEFT_ARM  XT30PW-F  [XT30PWF]
LEFT_ARM_EFUSE  43045-0400  [FP-43045-0400-MFG]
LEFT_LEG  XT30PW-F  [XT30PWF]
LEFT_LEG_EFUSE  43045-0400  [FP-43045-0400-MFG]
PROTECT  43045-0400  [FP-43045-0400-MFG]
RIGHT_ARM  XT30PW-F  [XT30PWF]
RIGHT_ARM_EFUSE  43045-0400  [FP-43045-0400-MFG]
RIGHT_LEG  XT30PW-F  [XT30PWF]
RIGHT_LEG_EFUSE  43045-0400  [FP-43045-0400-MFG]

### Ports
ENABLE (out, see Control[4B]), FAULT (in, see Control[4B], Protect[5C]), FLT_I1 (in, see Control[4B]), FLT_I2 (in, see Control[4B]), FLT_I3 (in, see Control[4B]), FLT_I4 (in, see Control[4B]), FLT_T1 (in, see Control[4B]), FLT_T2 (in, see Control[4B]), FLT_T3 (in, see Control[4B]), FLT_T4 (in, see Control[4B]), INP1 (in, see Control[4A]), INP2 (in, see Control[4A]), INP3 (in, see Control[4A]), INP4 (in, see Control[4A]), INP_G1 (in, see Control[4A]), INP_G2 (in, see Control[4A]), INP_G3 (in, see Control[4A]), INP_G4 (in, see Control[4A]), SENSE_OUT1 (in, see Control[4B]), SENSE_OUT2 (in, see Control[4B]), SENSE_OUT3 (in, see Control[4B]), SENSE_OUT4 (in, see Control[4B]), SHDN (out, see Control[4C], Protect[4C])

### Nets
GND: J711.1 J712.1 J715.1 J716.1 LEFT_ARM.1 LEFT_LEG.1 RIGHT_ARM.1 RIGHT_LEG.1
ENOUT: PROTECT.3 ; port ENABLE
FAULT: PROTECT.2 ; port FAULT
FLT_I1: RIGHT_ARM_EFUSE.3 ; port FLT_I1
FLT_I2: LEFT_LEG_EFUSE.3 ; port FLT_I2
FLT_I3: RIGHT_LEG_EFUSE.3 ; port FLT_I3
FLT_I4: LEFT_ARM_EFUSE.3 ; port FLT_I4
FLT_T1: RIGHT_ARM_EFUSE.4 ; port FLT_T1
FLT_T2: LEFT_LEG_EFUSE.4 ; port FLT_T2
FLT_T3: RIGHT_LEG_EFUSE.4 ; port FLT_T3
FLT_T4: LEFT_ARM_EFUSE.4 ; port FLT_T4
INP: RIGHT_ARM_EFUSE.1 ; port INP1
INP: LEFT_LEG_EFUSE.1 ; port INP2  [a separate net that carries the same name]
INP: RIGHT_LEG_EFUSE.1 ; port INP3  [a separate net that carries the same name]
INP: LEFT_ARM_EFUSE.1 ; port INP4  [a separate net that carries the same name]
INP_G: RIGHT_ARM_EFUSE.2 ; port INP_G1
INP_G: LEFT_LEG_EFUSE.2 ; port INP_G2  [a separate net that carries the same name]
INP_G: RIGHT_LEG_EFUSE.2 ; port INP_G3  [a separate net that carries the same name]
INP_G: LEFT_ARM_EFUSE.2 ; port INP_G4  [a separate net that carries the same name]
SENSE_OUT: J715.2 LEFT_ARM.2 ; port SENSE_OUT4
SENSE_OUT: J712.2 RIGHT_LEG.2 ; port SENSE_OUT3  [a separate net that carries the same name]
SENSE_OUT: J716.2 LEFT_LEG.2 ; port SENSE_OUT2  [a separate net that carries the same name]
SENSE_OUT: J711.2 RIGHT_ARM.2 ; port SENSE_OUT1  [a separate net that carries the same name]
SHDN: PROTECT.1 ; port SHDN

Not connected (* = marked no-connect by the designer): J711 3 4; J712 3 4; J715 3 4; J716 3 4; LEFT_ARM 3 4; LEFT_LEG 3 4; PROTECT 4; RIGHT_ARM 3 4; RIGHT_LEG 3 4

### Library data of the parts
J711 J712 J715 J716 LEFT_ARM LEFT_LEG RIGHT_ARM RIGHT_LEG = XT30PW-F: Connector; Manufacturer_Name: Amass; Datasheet Link: https://www.tme.eu/Document/ce4077e36b79046da520ca73227e15de/XT30PW%20SPEC.pdf; Height: 5mm; Manufacturer_Part_Number: XT30PW-F
LEFT_ARM_EFUSE LEFT_LEG_EFUSE PROTECT RIGHT_ARM_EFUSE RIGHT_LEG_EFUSE = CMP-04776-000002-1: CONN HEADER R/A 4POS 3MM; Manufacturer: Molex; Conn Gender: Male; Conn Orientation: Right Angle; Voltage Rating: 600V; Number Of Contacts: 4; Is Female: yes; Current Rating: 8.5A; ComponentLink2URL: https://www.molex.com/webdocs/datasheets/pdf/en-us/0430450400_PCB_HEADERS.pdf; Manufacturer Part Number: 43045-0400; Digikey Description: CONN HEADER R/A 4POS 3MM; Category: Conn; Temperature Range High: +105°C; Lead Free: Yes; Device Class L1: Connectors; Automotive: No; Temperature: -40°C to +105°C; Footprint Url: https://www.molex.com/pdm_docs/sd/430450400_sd.pdf; Height: 9.27mm; Number Of Rows: 2; Device Class L3: unset; Pitch: 3mm; Temperature Range Low: -40°C; Contact Material: Tin,Nickel; Octopart: https://octopart.com/43045-0400-molex-287063; RoHS: TRUE; ComponentLink2Description: Datasheet; Package: 43045-0400; Device Class L2: Headers and Wire Housings

## Sheet ORing.SchDoc
size A4; SheetNumber: 2; SheetTotal: 7
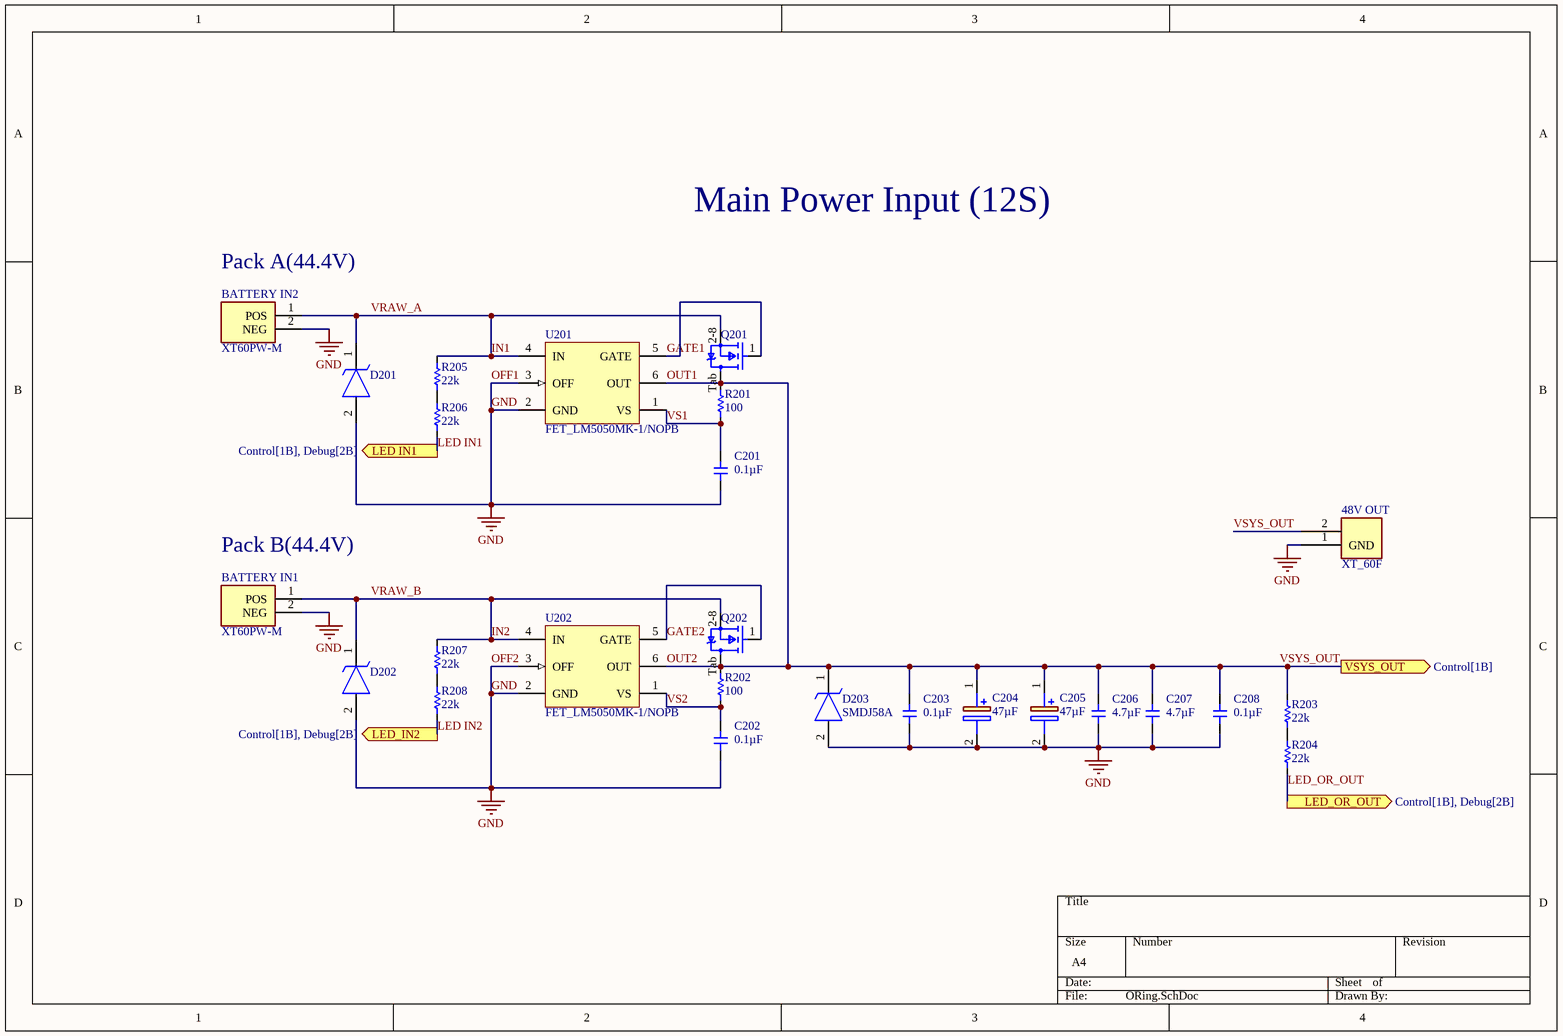
[diagram p4: ORing.SchDoc]

### Parts
48V_OUT  XT_60F  [XT60_F]
BATTERY_IN1  XT60PW-M  [XT60PW-M]
BATTERY_IN2  XT60PW-M  [XT60PW-M]
C201  Capacitance: 0.1µF  [C0603]  (hidden comment: C_0603_0P1UF_10P_100V_X7R)
C202  Capacitance: 0.1µF  [C0603]  (hidden comment: C_0603_0P1UF_10P_100V_X7R)
C203  Capacitance: 0.1µF  [C0603]  (hidden comment: C_0603_0P1UF_10P_100V_X7R)
C204  47µF  [CAPAE1030X1050N]
C205  47µF  [CAPAE1030X1050N]
C206  Capacitance: 4.7µF  [C1210]  (hidden comment: C_1210_4U7F_10P_100V_X7R)
C207  Capacitance: 4.7µF  [C1210]  (hidden comment: C_1210_4U7F_10P_100V_X7R)
C208  Capacitance: 0.1µF  [C0603]  (hidden comment: C_0603_0P1UF_10P_100V_X7R)
D201  SMDJ58A  [DIONM7959X262N]  (value not drawn)
D202  SMDJ58A  [DIONM7959X262N]  (value not drawn)
D203  SMDJ58A  [DIONM7959X262N]
Q201  Trans_Infineon_IPT015N10N5_eec  [Infineon_IPT015N10N5_0]  (value not drawn)
Q202  Trans_Infineon_IPT015N10N5_eec  [Infineon_IPT015N10N5_0]  (value not drawn)
R201  Resistance: 100  [R0603]  (hidden comment: R_0603_100R_1P_0P1W)
R202  Resistance: 100  [R0603]  (hidden comment: R_0603_100R_1P_0P1W)
R203  Resistance: 22k  [R0603]  (hidden comment: R_0603_22K_1P_0P1W)
R204  Resistance: 22k  [R0603]  (hidden comment: R_0603_22K_1P_0P1W)
R205  Resistance: 22k  [R0603]  (hidden comment: R_0603_22K_1P_0P1W)
R206  Resistance: 22k  [R0603]  (hidden comment: R_0603_22K_1P_0P1W)
R207  Resistance: 22k  [R0603]  (hidden comment: R_0603_22K_1P_0P1W)
R208  Resistance: 22k  [R0603]  (hidden comment: R_0603_22K_1P_0P1W)
U201  FET_LM5050MK-1/NOPB  [DDC0006A_M]
U202  FET_LM5050MK-1/NOPB  [DDC0006A_M]

### Ports
LED IN1 (out, see Control[1B], Debug[2B]), LED_IN2 (out, see Control[1B], Debug[2B]), LED_OR_OUT (out, see Control[1B], Debug[2B]), VSYS_OUT (out, see Control[1B])

### Nets
GND: 48V_OUT.1(GND) BATTERY_IN1.2(NEG) BATTERY_IN2.2(NEG) C201.1 C202.1 C203.1 C204.2(-) C205.2(-) C206.1 C207.1 C208.1 D201.2(A) D202.2(A) D203.2(A) U201.2(GND) U201.3(OFF) U202.2(GND) U202.3(OFF)  [also labelled OFF1, OFF2]
OUT1: 48V_OUT.2 C203.2 C204.1(+) C205.1(+) C206.2 C207.2 C208.2 D203.1(K) Q201.Tab(Drain) Q202.Tab(Drain) R201.2 R202.2 R203.2 U201.6(OUT) U202.6(OUT) ; port VSYS_OUT  [also labelled OUT2, VSYS_OUT]  [project net VSYS_IN]
GATE1: Q201.1(Gate) U201.5(GATE)
GATE2: Q202.1(Gate) U202.5(GATE)
IN1: BATTERY_IN2.1(POS) D201.1(K) Q201.2-8(Source) R205.2 U201.4(IN)  [also labelled VRAW_A]
IN2: BATTERY_IN1.1(POS) D202.1(K) Q202.2-8(Source) R207.2 U202.4(IN)  [also labelled VRAW_B]
LED IN1: R206.1 ; port LED IN1
LED IN2: R208.1 ; port LED_IN2
LED_OR_OUT: R204.1 ; port LED_OR_OUT
VS1: C201.2 R201.1 U201.1(VS)
VS2: C202.2 R202.1 U202.1(VS)
NetR203_1: R203.1 R204.2
NetR205_1: R205.1 R206.2
NetR207_1: R207.1 R208.2

### Notes on the sheet
- Main Power Input (12S)
- (near BATTERY_IN2) Pack A(44.4V)
- (near BATTERY_IN1) Pack B(44.4V)

### Library data of the parts
48V_OUT = CMP-019-000041-2: XT_60 Connector FEMAIL; Design Item ID: XT_60F; Source: robit_connector.SchLib; System: Connector
BATTERY_IN1 BATTERY_IN2 = CMP-019-000059-3: Socket, DC supply, male, PIN: 2; MF: AMASS; System: Connector; Package: Package; SnapEDA_Link: https://www.snapeda.com/parts/XT60PW-M/AMASS/view-part/?ref=snap; Design Item ID: XT60PW-M; Check_prices: https://www.snapeda.com/parts/XT60PW-M/AMASS/view-part/?ref=eda; MP: XT60PW-M; Price: None; Availability: Not in stock; Source: robit_connector.SchLib; Value: *
C201-C203 C208 = CMP-00021-3: MLCC, 0.1µF, 10%, 100V, X7R, 0603; Dielectric: X7R; Mounting Type: SMD; Tolerance: 10%; Package: 0603; Voltage Rating: 100V
C204 C205 = UUX2A470MNL1GS: as C500 on sheet e-Fuse; Datasheet Link: https://componentsearchengine.com/Datasheets/1/UUX2A470MNL1GS.pdf; Height: 10.5mm; Manufacturer_Part_Number: UUX2A470MNL1GS; Mouser Part Number: 647-UUX2A470MNL1GS; Mouser Price/Stock: https://www.mouser.co.uk/ProductDetail/Nichicon/UUX2A470MNL1GS?qs=jZZh9D7uMhmPZMofMKn2Fg%3D%3D; Arrow Part Number: UUX2A470MNL1GS; Arrow Price/Stock: https://www.arrow.com/en/products/uux2a470mnl1gs/nichicon?utm_currency=USD&region=nac
C206 C207 = CMP-00065-1: MLCC, 4.7µF, 10%, 100V, X7R, 1210; Package: 1210; Tolerance: 10%; Dielectric: X7R; Voltage Rating: 100V; Mounting Type: SMD
D201-D203 = SMDJ58A: TVS Diode (Uni-directional); Manufacturer_Name: LITTELFUSE; Datasheet Link: https://mouser.componentsearchengine.com/Datasheets/2/SMDJ58A.pdf; Height: 2.62mm; Manufacturer_Part_Number: SMDJ58A; Mouser Part Number: 576-SMDJ58A; Mouser Price/Stock: https://www.mouser.co.uk/ProductDetail/Littelfuse/SMDJ58A?qs=zL8PTTxXkF2zAaoXCy3ytQ%3D%3D; Arrow Part Number: SMDJ58A; Arrow Price/Stock: https://www.arrow.com/en/products/smdj58a/littelfuse?utm_currency=USD&region=nac
Q201 Q202 = Trans_Infineon_IPT015N10N5_eec: TRANS MOSFET N-CH 100V 300A 8HSOF; Part Number: IPT015N10N5; helpURL: https://upverter.com/upn/revision/59ddb1136ed40b7f/; ComponentLink2Description: Datasheet; Temperature: -55°C to +175°C; Package: HSOF8; Supplier 2: Mouser; Supplier 1: Digi-Key; ComponentLink1URL: https://upverter.com/upn/revision/59ddb1136ed40b7f/; Supplier Part Number 2: 726-IPT015N10N5ATMA1; Supplier Part Number 1: IPT015N10N5ATMA1CT-ND; Manufacturer: Infineon; ComponentLink1Description: Upverter; ComponentLink2URL: http://www.infineon.com/dgdl/Infineon-IPT015N10N5-DS-v02_02-EN.pdf?fileId=5546d4624a75e5f1014ac94680661aff; RoHS: TRUE; Mouser Part Number: 726-IPT015N10N5ATMA1; Temperature Range High: +175°C; Digikey Description: TRANS MOSFET N-CH 100V 300A 8HSOF; Digikey Part Number: IPT015N10N5ATMA1CT-ND; Lead Free: yes; Temperature Range Low: -55°C
R201 R202 = CMP-00048-1: as R508 on sheet e-Fuse; Tolerance: 1%; Mounting Type: SMD; Package: 0603
R203-R208 = CMP-00064-1: as R413 on sheet Protect; Tolerance: 1%; Mounting Type: SMD; Package: 0603
U201 U202 = CMP-026-000034-1: 5-V to 75-V 400-uA IQ ORing FET controller 6-SOT-23-THIN -40 to 125

## Sheet Sensing.SchDoc
size A4; SheetNumber: 5; SheetTotal: 7
Used 4 times, as channels Sensing1, Sensing2, Sensing3, Sensing4. Parts and nets are listed once, with the designators drawn on the sheet.
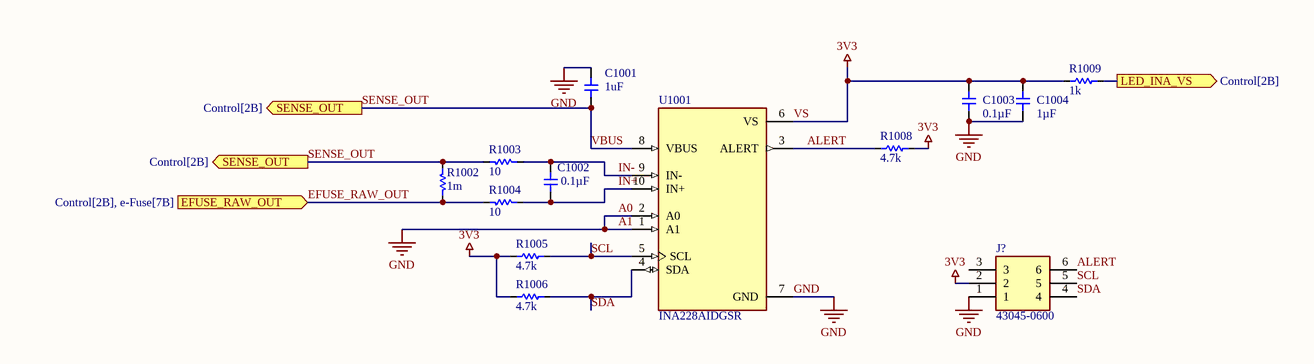
[diagram p5: Sensing.SchDoc]

### Parts
C1001  Capacitance: 1uF  [C1210]  (hidden comment: C_1210_1UF_10P_100V_X7R)
C1002  Capacitance: 0.1µF  [C0603]  (hidden comment: C_0603_0P1UF_10P_100V_X7R)
C1003  Capacitance: 0.1µF  [C0603]  (hidden comment: C_0603_0P1UF_10P_100V_X7R)
C1004  Capacitance: 1µF  [C0603]  (hidden comment: C_0603_1UF_10P_25V_X7R)
J?  43045-0600  [43045-06(00,01,02,10)]
R1002  Resistance: 1m  [R2512]  (hidden comment: R_2512_1R_1P_5W)
R1003  Resistance: 10  [R0603]  (hidden comment: R_0603_10R_1P_0P1W)
R1004  Resistance: 10  [R0603]  (hidden comment: R_0603_10R_1P_0P1W)
R1005  Resistance: 4.7k  [R0603]  (hidden comment: R_0603_4K7_1P_0P1W)
R1006  Resistance: 4.7k  [R0603]  (hidden comment: R_0603_4K7_1P_0P1W)
R1008  Resistance: 4.7k  [R0603]  (hidden comment: R_0603_4K7_1P_0P1W)
R1009  Resistance: 1k  [R0603]  (hidden comment: R_0603_1K_1P_0P1W)
U1001  INA228AIDGSR  [SOP50P490X110-10N]

### Ports
EFUSE_RAW_OUT (in, see Control[2B], e-Fuse[7B]), LED_INA_VS (out, see Control[2B]), SENSE_OUT (out, see Control[2B])

### Nets
3V3: C1003.2 C1004.2 J?.2 R1005.1 R1006.1 R1008.2 R1009.2 U1001.6(VS)  [also labelled VS]
GND: C1001.2 C1003.1 C1004.1 J?.1 U1001.1(A1) U1001.2(A0) U1001.7(GND)  [also labelled \, A0, A1]
ALERT: J?.6 R1008.1 U1001.3(ALERT)
EFUSE_RAW_OUT: R1002.1 R1004.2 ; port EFUSE_RAW_OUT
IN+: C1002.1 R1004.1 U1001.10(IN+)
IN-: C1002.2 R1003.1 U1001.9(IN-)
LED_INA_VS: R1009.1 ; port LED_INA_VS
SCL: J?.5 R1005.2 U1001.5(SCL)
SDA: J?.4 R1006.2 U1001.4(SDA)
SENSE_OUT: C1001.1 R1002.2 R1003.2 U1001.8(VBUS) ; port SENSE_OUT  [also labelled VBUS]

Not connected (* = marked no-connect by the designer): J? 3

### Channels
Sensing1: designators C1001=C1001_1 C1002=C1002_1 C1003=C1003_1 C1004=C1004_1 J?=RIGHT_ARM_SENSOR R1002=R1002_1 R1003=R1003_1 R1004=R1004_1 R1005=R1005_1 R1006=R1006_1 R1008=R1008_1 R1009=R1009_1 U1001=U1001_1; ports EFUSE_RAW_OUT=EFUSE_RAW_OUT LED_INA_VS=LED_INA_VS1 SENSE_OUT=SENSE_OUT
Sensing2: designators C1001=C1001_2 C1002=C1002_2 C1003=C1003_2 C1004=C1004_2 J?=RIGHT_LEG_SENSOR#1 R1002=R1002_2 R1003=R1003_2 R1004=R1004_2 R1005=R1005_2 R1006=R1006_2 R1008=R1008_2 R1009=R1009_2 U1001=U1001_2; ports EFUSE_RAW_OUT=EFUSE_RAW_OUT LED_INA_VS=LED_INA_VS2 SENSE_OUT=SENSE_OUT
Sensing3: designators C1001=C1001_3 C1002=C1002_3 C1003=C1003_3 C1004=C1004_3 J?=RIGHT_LEG_SENSOR#2 R1002=R1002_3 R1003=R1003_3 R1004=R1004_3 R1005=R1005_3 R1006=R1006_3 R1008=R1008_3 R1009=R1009_3 U1001=U1001_3; ports EFUSE_RAW_OUT=EFUSE_RAW_OUT LED_INA_VS=LED_INA_VS3 SENSE_OUT=SENSE_OUT
Sensing4: designators C1001=C1001_4 C1002=C1002_4 C1003=C1003_4 C1004=C1004_4 J?=LEFT_ARM_SENSOR R1002=R1002_4 R1003=R1003_4 R1004=R1004_4 R1005=R1005_4 R1006=R1006_4 R1008=R1008_4 R1009=R1009_4 U1001=U1001_4; ports EFUSE_RAW_OUT=EFUSE_RAW_OUT LED_INA_VS=LED_INA_VS4 SENSE_OUT=SENSE_OUT

### Library data of the parts
C1001 = CMP-00023-3: MLCC, 1µF, 10%, 100V, X7R, 0603; Voltage Rating: 100V; Mounting Type: SMD; Package: 1210; Tolerance: 10%; Dielectric: X7R
C1002 C1003 = CMP-00021-3: MLCC, 0.1µF, 10%, 100V, X7R, 0603; Dielectric: X7R; Mounting Type: SMD; Tolerance: 10%; Package: 0603; Voltage Rating: 100V
C1004 = CMP-00025-2: MLCC, 1µF, 10%, 25V, X7R, 0603; Dielectric: X7R; Tolerance: 10%; Voltage Rating: 25V; Package: 0603; Mounting Type: SMD
J? = 43045-0600: Connector; Manufacturer_Name: Molex; Datasheet Link: https://www.molex.com/pdm_docs/sd/430450200_sd.pdf; Height: 9.9mm; Manufacturer_Part_Number: 43045-0600; Mouser Part Number: 538-43045-0600; Mouser Price/Stock: https://www.mouser.co.uk/ProductDetail/Molex/43045-0600?qs=mrPiglD9aYJ8CzJ%2FE2PNbw%3D%3D; Arrow Part Number: 43045-0600; Arrow Price/Stock: https://www.arrow.com/en/products/43045-0600/molex?region=nac
R1002 = CMP-00015-10: Chip resistor, 1m Ohm, ±1%, 5W, 2512; Package: 2512; Power Rating: 5W; Tolerance: 1%; Mounting Type: SMD
R1003 R1004 = CMP-00010-8: Chip resistor, 10 Ohm, 1%, 0.1W, 0603; Voltage Rating: 50V; Power Rating: 100mW; Mounting Type: SMD; Package: 0603; Tolerance: 1%
R1005 R1006 R1008 = CMP-00011-6: Chip resistor, 4.7k Ohm, 1%, 0.1W, 0603; Power Rating: 100mW; Voltage Rating: 75V; Tolerance: 1%; Package: 0603; Mounting Type: SMD
R1009 = CMP-00012-6: as R505 on sheet e-Fuse; Mounting Type: SMD; Package: 0603; Tolerance: 1%
U1001 = CMP-303-000000-1: 85-V, 20-bit, ultra-precise, I2C output current/voltage/power/energy/charge monitor with alert; MF: Texas Instruments; Pin Count: 10; Check_prices: https://www.snapeda.com/parts/INA228AIDGSR/Texas+Instruments/view-part/?ref=eda; SnapEDA_Link: https://www.snapeda.com/parts/INA228AIDGSR/Texas+Instruments/view-part/?ref=snap; Source: INA228AIDGSR.SchLib; Component Type: Standard; Value: *; Design Item ID: INA228AIDGSR; MP: INA228AIDGSR; Package: VSSOP-10 Texas Instruments

## Sheet Debug.SchDoc
size A4; SheetNumber: 7; SheetTotal: 7
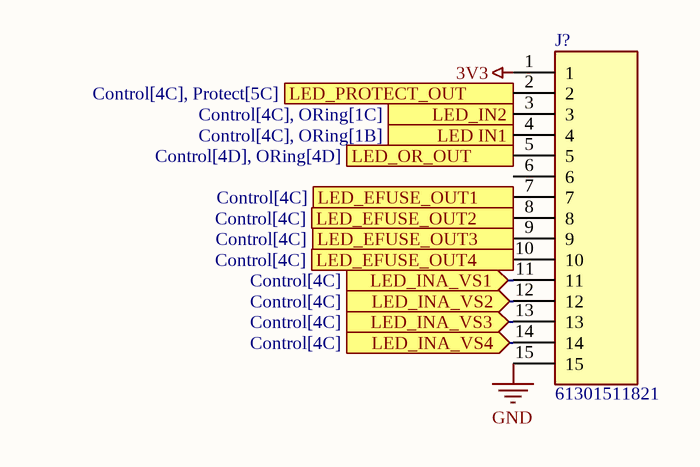
[diagram p6: Debug.SchDoc]

### Parts
J?  61301511821  [61301511821]

### Ports
LED IN1 (in, see Control[4C], ORing[1B]), LED_EFUSE_OUT1 (in, see Control[4C]), LED_EFUSE_OUT2 (in, see Control[4C]), LED_EFUSE_OUT3 (in, see Control[4C]), LED_EFUSE_OUT4 (in, see Control[4C]), LED_IN2 (in, see Control[4C], ORing[1C]), LED_INA_VS1 (in, see Control[4C]), LED_INA_VS2 (in, see Control[4C]), LED_INA_VS3 (in, see Control[4C]), LED_INA_VS4 (in, see Control[4C]), LED_OR_OUT (in, see Control[4D], ORing[4D]), LED_PROTECT_OUT (in, see Control[4C], Protect[5C])

### Nets
3V3: J?.1
GND: J?.15
LED IN1: J?.4 ; port LED IN1
LED IN2: J?.3 ; port LED_IN2
LED_EFUSE_OUT1: J?.7 ; port LED_EFUSE_OUT1
LED_EFUSE_OUT2: J?.8 ; port LED_EFUSE_OUT2
LED_EFUSE_OUT3: J?.9 ; port LED_EFUSE_OUT3
LED_EFUSE_OUT4: J?.10 ; port LED_EFUSE_OUT4
LED_INA_VS1: J?.11 ; port LED_INA_VS1
LED_INA_VS2: J?.12 ; port LED_INA_VS2
LED_INA_VS3: J?.13 ; port LED_INA_VS3
LED_INA_VS4: J?.14 ; port LED_INA_VS4
LED_OR_OUT: J?.5 ; port LED_OR_OUT
NetJ?_2: J?.2 ; port LED_PROTECT_OUT

Not connected (* = marked no-connect by the designer): J? 6

### Library data of the parts
J? = 61301511821: Connector; Manufacturer_Name: Wurth Elektronik; Datasheet Link: https://www.we-online.com/catalog/datasheet/61301511821.pdf; Height: 8.65mm; Manufacturer_Part_Number: 61301511821

## Nets that join several sheets
3V3: Protect (R415.1 R416.1), e-Fuse1 (R515_1.1 R516_1.1), e-Fuse2 (R515_2.1 R516_2.1), e-Fuse3 (R515_3.1 R516_3.1), e-Fuse4 (R515_4.1 R516_4.1), Sensing1 (8 pins), Sensing2 (8 pins), Sensing3 (8 pins), Sensing4 (8 pins), Debug (J?.1)
GND: Protect (8 pins), e-Fuse1 (14 pins), e-Fuse2 (14 pins), e-Fuse3 (14 pins), e-Fuse4 (14 pins), Connector (8 pins), ORing (18 pins), Sensing1 (7 pins), Sensing2 (7 pins), Sensing3 (7 pins), Sensing4 (7 pins), Debug (J?.15)
VSYS_IN: Protect (5 pins), ORing (15 pins)
EFUSE_RAW_OUT: e-Fuse1 (D502_1.2 Q503_1.5-6 R413_1.2), Sensing1 (R1002_1.1 R1004_1.2)
EFUSE_RAW_OUT: e-Fuse2 (D502_2.2 Q503_2.5-6 R413_2.2), Sensing2 (R1002_2.1 R1004_2.2)
EFUSE_RAW_OUT: e-Fuse3 (D502_3.2 Q503_3.5-6 R413_3.2), Sensing3 (R1002_3.1 R1004_3.2)
EFUSE_RAW_OUT: e-Fuse4 (D502_4.2 Q503_4.5-6 R413_4.2), Sensing4 (R1002_4.1 R1004_4.2)
ENOUT: Protect (R416.2 U401.14), Connector (PROTECT.3)
FAULT: Protect (R415.2 U401.13), Connector (PROTECT.2)
FLT_I1: e-Fuse1 (R506_1.1), Connector (RIGHT_ARM_EFUSE.3)
FLT_I2: e-Fuse2 (R506_2.1), Connector (LEFT_LEG_EFUSE.3)
FLT_I3: e-Fuse3 (R506_3.1), Connector (RIGHT_LEG_EFUSE.3)
FLT_I4: e-Fuse4 (R506_4.1), Connector (LEFT_ARM_EFUSE.3)
FLT_T1: e-Fuse1 (R505_1.1), Connector (RIGHT_ARM_EFUSE.4)
FLT_T2: e-Fuse2 (R505_2.1), Connector (LEFT_LEG_EFUSE.4)
FLT_T3: e-Fuse3 (R505_3.1), Connector (RIGHT_LEG_EFUSE.4)
FLT_T4: e-Fuse4 (R505_4.1), Connector (LEFT_ARM_EFUSE.4)
I_SENSE_N: Protect (6 pins), e-Fuse1 (11 pins), e-Fuse2 (11 pins), e-Fuse3 (11 pins), e-Fuse4 (11 pins)
INP: e-Fuse1 (IC501_1.3), Connector (RIGHT_ARM_EFUSE.1)
INP: e-Fuse2 (IC501_2.3), Connector (LEFT_LEG_EFUSE.1)
INP: e-Fuse3 (IC501_3.3), Connector (RIGHT_LEG_EFUSE.1)
INP: e-Fuse4 (IC501_4.3), Connector (LEFT_ARM_EFUSE.1)
INP_G: e-Fuse1 (IC501_1.2), Connector (RIGHT_ARM_EFUSE.2)
INP_G: e-Fuse2 (IC501_2.2), Connector (LEFT_LEG_EFUSE.2)
INP_G: e-Fuse3 (IC501_3.2), Connector (RIGHT_LEG_EFUSE.2)
INP_G: e-Fuse4 (IC501_4.2), Connector (LEFT_ARM_EFUSE.2)
LED IN1: ORing (R206.1), Debug (J?.4)
LED IN2: ORing (R208.1), Debug (J?.3)
LED_EFUSE_OUT1: e-Fuse1 (R414_1.1), Debug (J?.7)
LED_EFUSE_OUT2: e-Fuse2 (R414_2.1), Debug (J?.8)
LED_EFUSE_OUT3: e-Fuse3 (R414_3.1), Debug (J?.9)
LED_EFUSE_OUT4: e-Fuse4 (R414_4.1), Debug (J?.10)
LED_INA_VS1: Sensing1 (R1009_1.1), Debug (J?.11)
LED_INA_VS2: Sensing2 (R1009_2.1), Debug (J?.12)
LED_INA_VS3: Sensing3 (R1009_3.1), Debug (J?.13)
LED_INA_VS4: Sensing4 (R1009_4.1), Debug (J?.14)
LED_OR_OUT: ORing (R204.1), Debug (J?.5)
NetJ?_2: Protect (R414.1), Debug (J?.2)
SENSE_OUT: Connector (J715.2 LEFT_ARM.2), Sensing4 (C1001_4.1 R1002_4.2 R1003_4.2 U1001_4.8)
SENSE_OUT: Connector (J712.2 RIGHT_LEG.2), Sensing3 (C1001_3.1 R1002_3.2 R1003_3.2 U1001_3.8)
SENSE_OUT: Connector (J716.2 LEFT_LEG.2), Sensing2 (C1001_2.1 R1002_2.2 R1003_2.2 U1001_2.8)
SENSE_OUT: Connector (J711.2 RIGHT_ARM.2), Sensing1 (C1001_1.1 R1002_1.2 R1003_1.2 U1001_1.8)
SHDN: Protect (U401.9), Connector (PROTECT.1)